# Altium schematic sheet PFC-Sheet.SchDoc (part 1 of 3)
size 420 x 297 mm; SheetNumber: 2; SheetTotal: 4
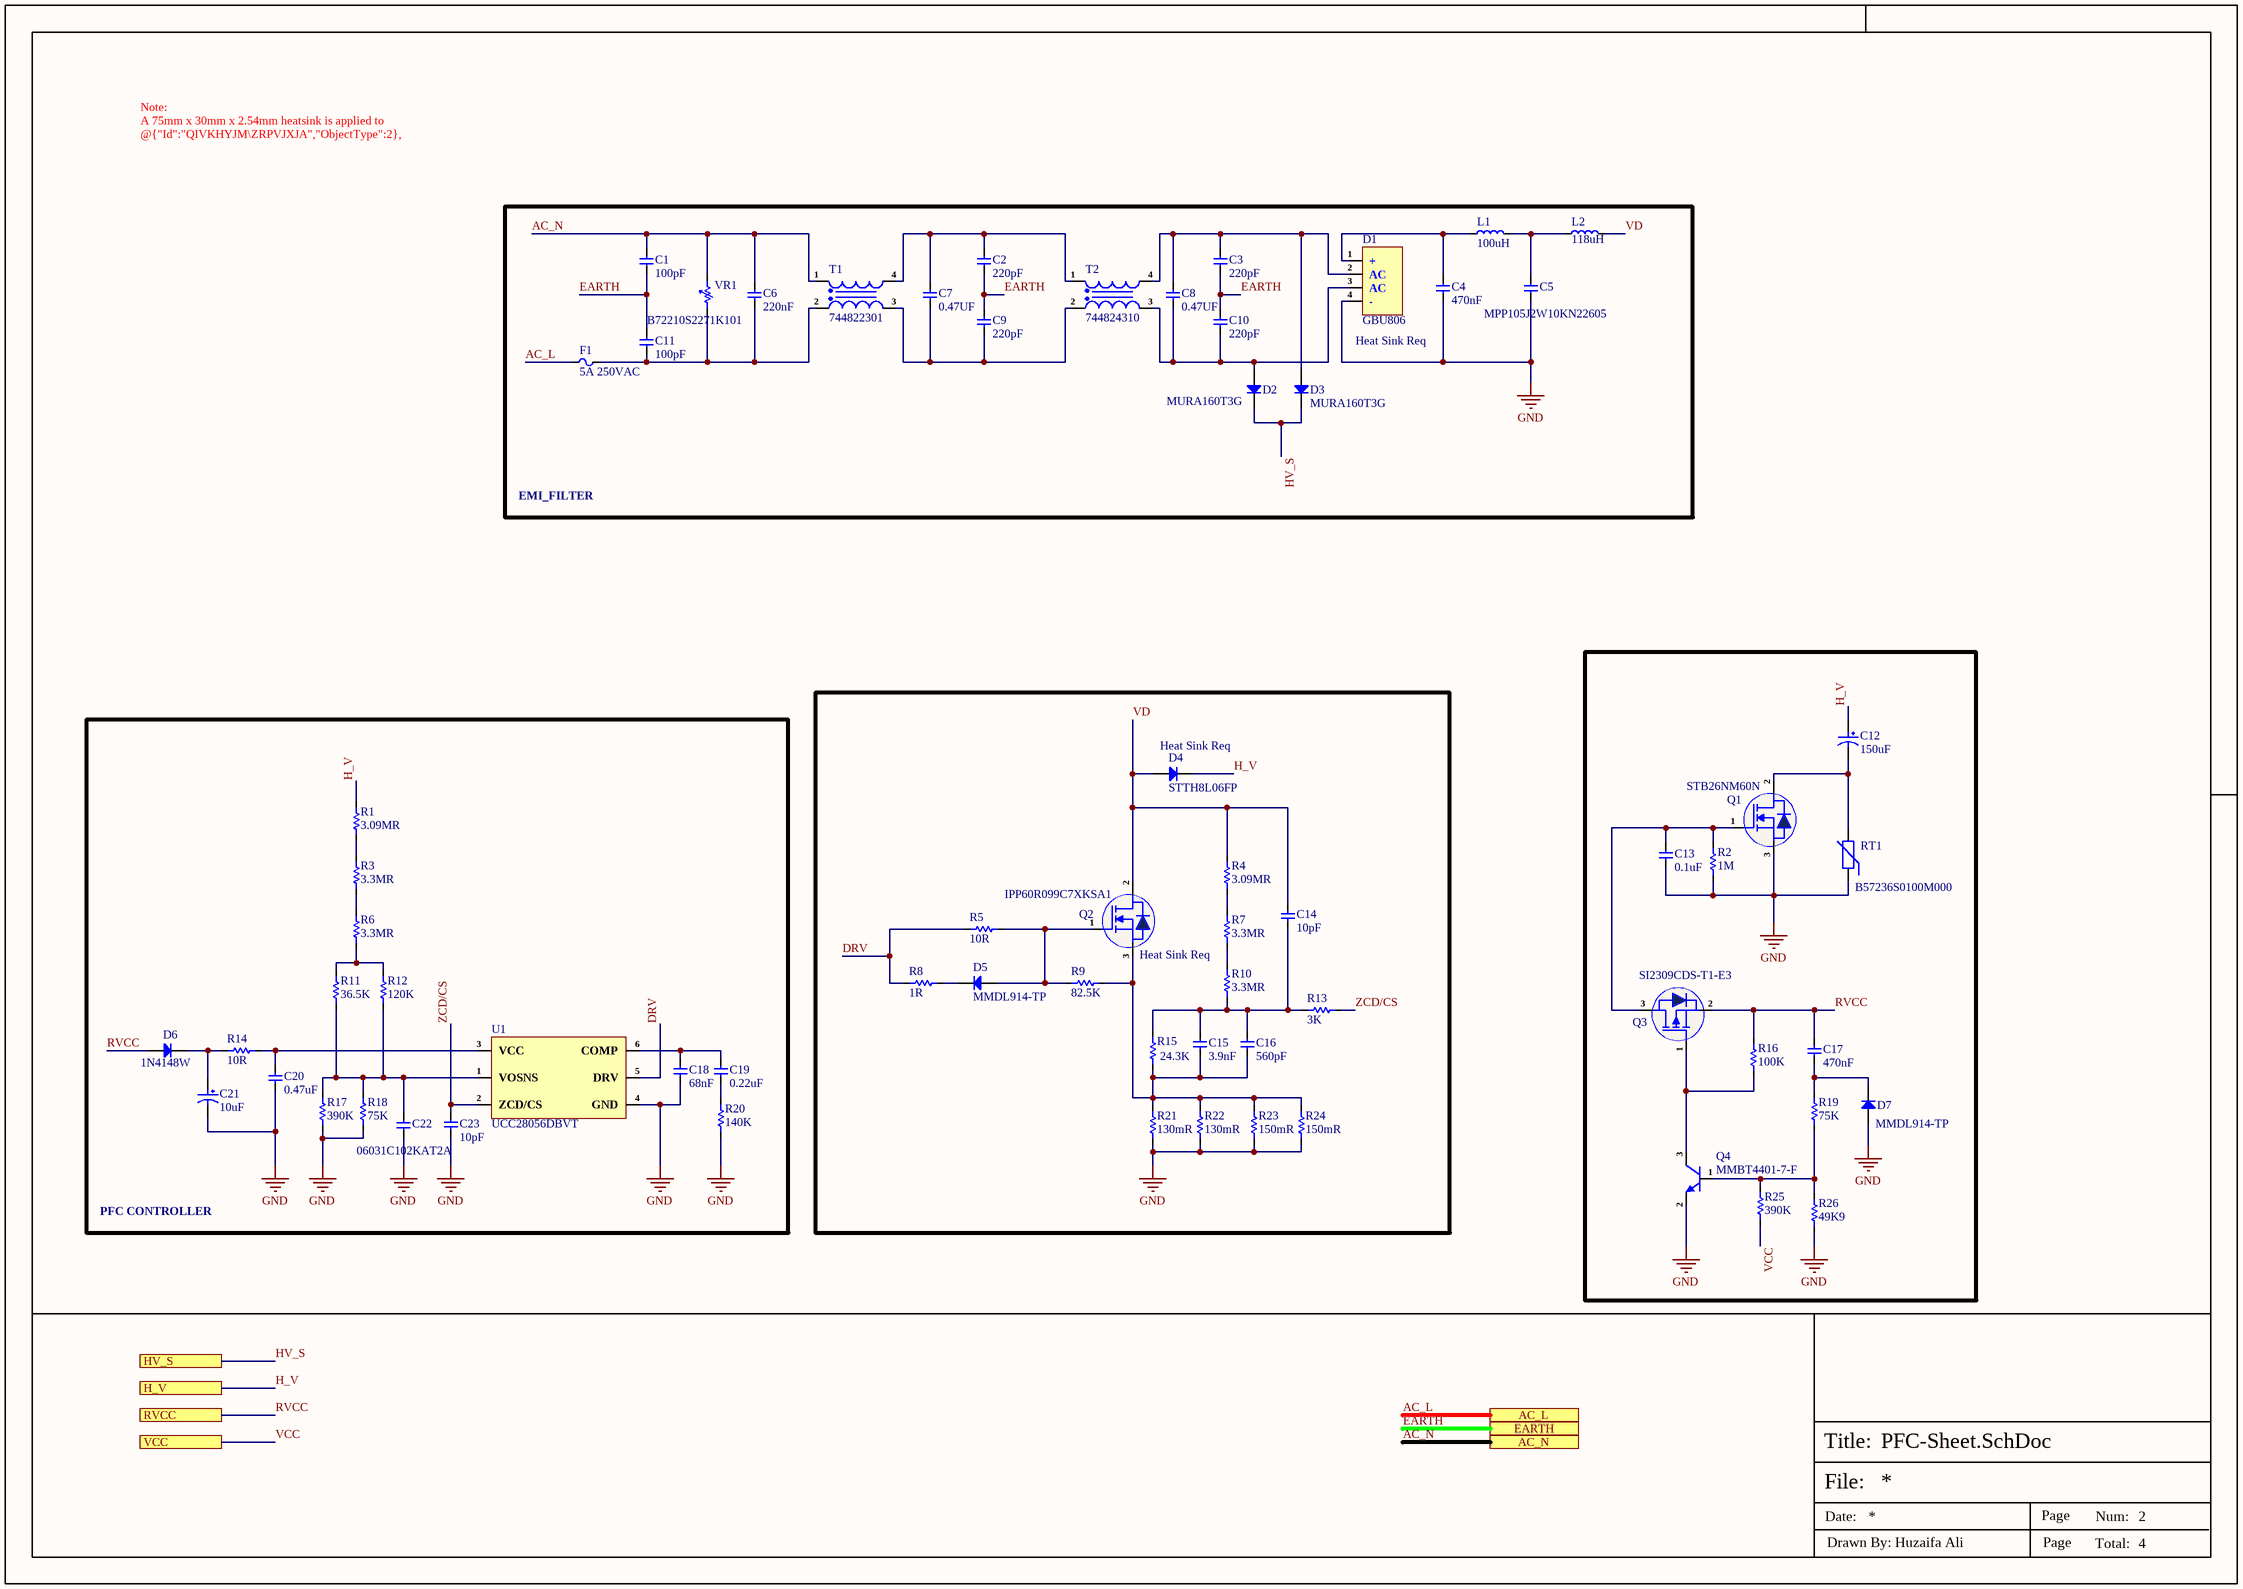
[diagram p0: PFC-Sheet.SchDoc]

## Parts
C1  100pF  [DE1B3RA101KN4AN01F]
C2  220pF  [DE1B3RA221KN4AN01F]
C3  220pF  [DE1B3RA221KN4AN01F]
C4  470nF  [450MPK474J]
C5  MPP105J2W10KN22605  [MPP105J2W10KN22605]
C6  220nF  [X2P2224KN1B0130150080ES0]
C7  0.47UF  [890324024005]
C8  0.47UF  [890324024005]
C9  220pF  [DE1B3RA221KN4AN01F]
C10  220pF  [DE1B3RA221KN4AN01F]
C11  100pF  [DE1B3RA101KN4AN01F]
C12  150uF  [KN151M45025*30A]
C13  0.1uF  [Cap-0603]
C14  10pF  [Cap-1206]
C15  3.9nF  [Cap-0603]
C16  560pF  [Cap-0603]
C17  470nF  [Cap-1206]
C18  68nF  [Cap-0603]
C19  0.22uF  [Cap-0603]
C20  0.47uF  [Cap-1206]
C21  10uF  [50SVPF10M]
C22  06031C102KAT2A  [Cap-0603]
C23  10pF  [Cap-0603]
D1  GBU806  [GBU]
D2  MURA160T3G  [SMA]
D3  MURA160T3G  [SMA]
D4  STTH8L06FP  [TO-220-2]
D5  MMDL914-TP  [SOD-323]
D6  1N4148W  [SOD-123]
D7  MMDL914-TP  [SOD-323]
F1  5A 250VAC  [37215000001]
L1  100uH  [7447021]
L2  118uH  [760801401]
Q1  STB26NM60N  [TO-263]
Q2  IPP60R099C7XKSA1  [TO-220-3]
Q3  SI2309CDS-T1-E3  [SOT-23]
Q4  MMBT4401-7-F  [SOT-23]
R1  3.09MR  [Res-1206]
R2  1M  [RES-0805]
R3  3.3MR  [Res-1206]
R4  3.09MR  [Res-1206]
R5  10R  [Res-0603]
R6  3.3MR  [Res-1206]
R7  3.3MR  [Res-1206]
R8  1R  [Res-0603]
R9  82.5K  [Res-0603]
R10  3.3MR  [Res-1206]
R11  36.5K  [Res-0603]
R12  120K  [Res-0603]
R13  3K  [Res-0603]
R14  10R  [RES-0805]
R15  24.3K  [Res-0603]
R16  100K  [Res-0603]
R17  390K  [Res-0603]
R18  75K  [Res-0603]
R19  75K  [Res-0603]
R20  140K  [Res-0603]
R21  130mR  [Res-1206]
R22  130mR  [Res-1206]
R23  150mR  [Res-1206]
R24  150mR  [Res-1206]
R25  390K  [Res-0603]
R26  49K9  [Res-0603]
RT1  B57236S0100M000  [B57236S0100M000]
T1  744822301  [744822301]
T2  744824310  [744824310]
U1  UCC28056DBVT  [SOT-23-6]
VR1  B72210S2271K101  [B72210S2271K101]

## Blocks framed on the sheet
PFC CONTROLLER: C18-C23 D6 R1 R3 R6 R11 R12 R14 R17 R18 R20 U1

## Ports
AC_L (see Top-Sheet[2B], Connector-Sheet[5D]), AC_N (see Top-Sheet[2B], Connector-Sheet[5D]), EARTH (see Top-Sheet[2B], Connector-Sheet[5D]), H_V (see Top-Sheet[2B], Power_Controller-Sheet[4D]), HV_S (see Top-Sheet[2B], Power_Controller-Sheet[4D]), RVCC (see Top-Sheet[2B], Power_Controller-Sheet[4D]), VCC (see Top-Sheet[2B], Power_Controller-Sheet[4D])

## Nets
GND: C4.1 C5.1 C13.1 C18.1 C20.1 C21.2 C22.1 C23.2 D1.4(-) D7.2(A) Q1.3(S) Q4.2(E) R2.1 R17.1 R18.1 R20.1 R21.2 R22.2 R23.1 R24.1 R26.1 RT1.1 U1.4(GND)
AC_L: F1.1 ; port AC_L
AC_N: C1.2 C6.2 T1.1 VR1.2 ; port AC_N
DRV: R5.1 R8.1 U1.5(DRV)
EARTH: C1.1 C2.1 C3.1 C9.2 C10.2 C11.2 ; port EARTH
H_V: C12.1 D4.1(K) R1.2 ; port H_V
HV_S: D2.1(K) D3.1(K) ; port HV_S
RVCC: C17.2 D6.1(A) Q3.2(S) R16.2 ; port RVCC
VCC: R25.1 ; port VCC
VD: C14.2 D4.2(A) L2.2 Q2.2(D) R4.2
ZCD/CS: C23.1 R13.2 U1.2(ZCD/CS)
NetC2_2: C2.2 C7.2 T1.4 T2.1
NetC3_2: C3.2 C8.2 D1.2(AC) D3.2(A) T2.4
NetC4_2: C4.2 D1.1(+) L1.1
NetC5_2: C5.2 L1.2 L2.1
NetC6_1: C6.1 C11.1 F1.2 T1.2 VR1.1
NetC7_1: C7.1 C9.1 T1.3 T2.2
NetC8_1: C8.1 C10.1 D1.3(AC) D2.2(A) T2.3
NetC12_2: C12.2 Q1.2(D) RT1.2
NetC13_2: C13.2 Q1.1(G) Q3.3(D) R2.2
NetC14_1: C14.1 C15.2 C16.2 R10.1 R13.1 R15.2
NetC15_1: C15.1 C16.1 Q2.3(S) R9.2 R15.1 R21.1 R22.1 R23.2 R24.2
NetC17_1: C17.1 D7.1(K) R19.2
NetC18_2: C18.2 C19.2 U1.6(COMP)
NetC19_1: C19.1 R20.2
NetC20_2: C20.2 R14.2 U1.3(VCC)
NetC21_1: C21.1 D6.2(K) R14.1
NetC22_2: C22.2 R11.1 R12.1 R17.2 R18.2 U1.1(VOSNS)
NetD5_1: D5.1(K) R8.2
NetD5_2: D5.2(A) Q2.1(G) R5.2 R9.1
NetQ3_1: Q3.1(G) Q4.3(C) R16.1
NetQ4_1: Q4.1(B) R19.1 R25.2 R26.2
NetR1_1: R1.1 R3.2
NetR3_1: R3.1 R6.2
NetR4_1: R4.1 R7.2
NetR6_1: R6.1 R11.2 R12.2
NetR7_1: R7.1 R10.2

## Notes on the sheet
- Note:
  A 75mm x 30mm x 2.54mm heatsink is applied to @{"Id":"QIVKHYJM\ZRPVJXJA","ObjectType":2}, @{"Id":"QIVKHYJM\BHMBXCNW","ObjectType":2} & @{"Id":"QIVKHYJM\CMETDYOG","ObjectType":2}
- Heat Sink Req
- EMI_FILTER
- (near D4) Heat Sink Req
- File:
- Title:
- Date:
- Page
- Num:
- Total:
- Drawn By: Huzaifa Ali